# Altium project Robot_Arm.PrjPcb
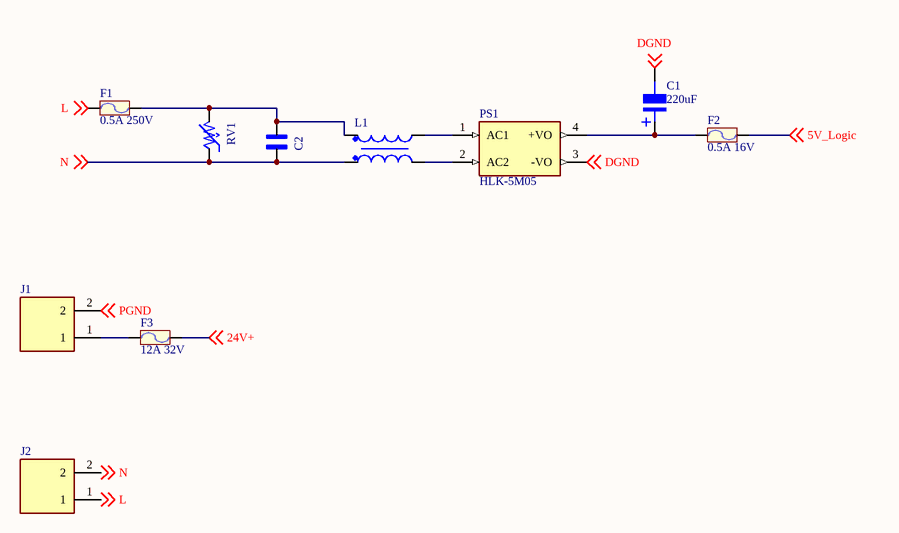
[diagram p0: Sources.SchDoc]
7 sheets, 147 parts. Net scope: global (net labels, ports and power ports of the same name join across sheets).
Sheets:
  Sources.SchDoc
  Driver_1.SchDoc
  Buck_Converter.SchDoc
  ESP32_Board.SchDoc
  Driver_2.SchDoc
  Driver_3.SchDoc
  Driver_4.SchDoc

## Sheet Sources.SchDoc
size A4; SheetNumber: 1; SheetTotal: 7

### Parts
C1  220uF  [tu nhom 8 (e)]
C2  R46KI315050M2K  [CAPRR1500W60L1800T600H1210]  (value not drawn)
F1  0.5A 250V  [Cau Chi SMD1808]
F2  0.5A 16V  [Cau Chi SMD1808]
F3  12A 32V  [Cau Chi SMD1808]
J1  KF301-2P  [HANDSON_KF301-2P]  (value not drawn)
J2  KF301-2P  [HANDSON_KF301-2P]  (value not drawn)
L1  WE-CMB_XS  [WE-CMB_XS]  (value not drawn)
PS1  HLK-5M05  [CONV_HLK-5M05]
RV1  MOV-10D561K  [VAR_MOV-10D561K]  (value not drawn)

### Nets
5V_Logic: F2.2 ; off-sheet 5V_Logic
24V+: F3.2 ; off-sheet 24V+
DGND: C1.2 PS1.3(-VO) ; off-sheet DGND
L: F1.1 J2.1 ; off-sheet L
N: C2.2 J2.2 L1.2 RV1.1 ; off-sheet N
PGND: J1.2 ; off-sheet PGND
NetC1_1: C1.1 F2.1 PS1.4(+VO)
NetC2_1: C2.1 F1.2 L1.1 RV1.2
NetF3_1: F3.1 J1.1
NetL1_3: L1.3 PS1.2(AC2)
NetL1_4: L1.4 PS1.1(AC1)

### Notes on the sheet
- (in symbol Tu Nhom 220uF 10V) +

### Library data of the parts
C1 = Tu Nhom 220uF 10V: Dán; So_Chan: 2; Ten_Linh_Kien: Tụ Nhôm 220uF 10V; Ma_Hang: MH004021; Don_Vi: Con; Chung_Loai: Dán; Kieu_Chan: *
C2 = R46KI315050M2K: 0.15 ÂµF Film Capacitor 275V 560V Polypropylene (PP), Metallized Radial; MF: KEMET; SnapEDA_Link: https://www.snapeda.com/parts/R46KI315050M2K/KEMET/view-part/?ref=snap; Package: RADIAL-2 KEMET; Value: *; MP: R46KI315050M2K; Check_prices: https://www.snapeda.com/parts/R46KI315050M2K/KEMET/view-part/?ref=eda
F1-F3 = Cau chi 0.5A 125V SMD1808: Ma_Hang: MH009241; Ten: Cầu Chì 0.5A 125V SMD1808 0451.500MRL
J1 J2 = KF301-2P: 2 Pin Terminal Block 5mm Pitch; MF: Handson Technology; SnapEDA_Link: https://www.snapeda.com/parts/KF301-2P/Handson+Technology/view-part/?ref=snap; Package: None; Value: *; MP: KF301-2P; Check_prices: https://www.snapeda.com/parts/KF301-2P/Handson+Technology/view-part/?ref=eda
L1 = WE-CMB_XS: Size Typ XS; L = 10 mH; IR = 0.7 A; RDC = 350 mâ„¦; MF: Wurth Electronics; MP: 744821110; SnapEDA_Link: https://www.snapeda.com/parts/744821110/Wurth+Electronics/view-part/?ref=snap; Package: Vertical-4 WÃ¼rth Elektronik; Value: *; Check_prices: https://www.snapeda.com/parts/744821110/Wurth+Electronics/view-part/?ref=eda
PS1 = HLK-5M05: AC DC 220V to 5V 5W 5Watt Isolated Switching Step-Down Power Supply Module Converter; MF: Hi-link; Check_prices: https://www.snapeda.com/parts/HLK-5M05/Hi-link/view-part/?ref=eda; SnapEDA_Link: https://www.snapeda.com/parts/HLK-5M05/Hi-link/view-part/?ref=snap; Price: None; Availability: Not in stock; Package: Package; MP: HLK-5M05; Value: *
RV1 = MOV-10D561K: 560 V 2.5 kA Varistor 1 Circuit Through Hole Disc 10mm; MF: Bourns; SnapEDA_Link: https://www.snapeda.com/parts/MOV-10D561K/Bourns/view-part/?ref=snap; Package: Package; Value: *; MP: MOV-10D561K; Check_prices: https://www.snapeda.com/parts/MOV-10D561K/Bourns/view-part/?ref=eda

## Sheet Driver_1.SchDoc
size A4; SheetNumber: 2; SheetTotal: 7
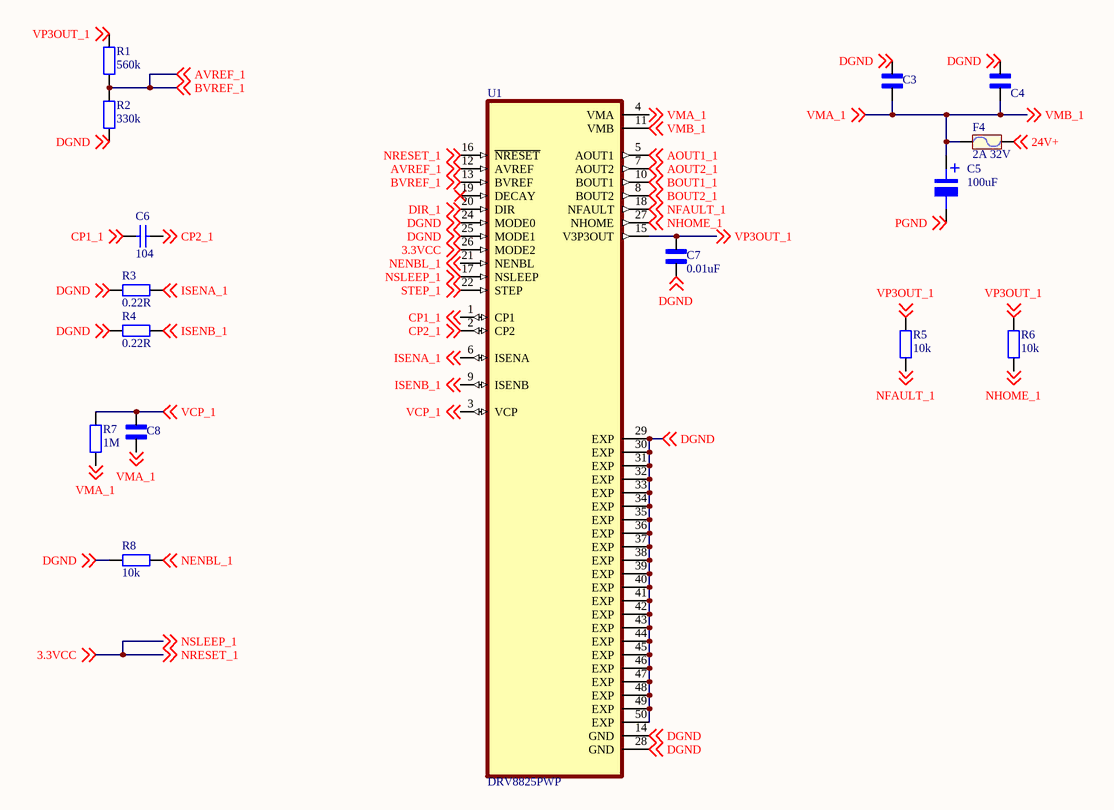
[diagram p1: Driver_1.SchDoc]

### Parts
C3  C0402C104K3RACTU  [CAPC1005X55N]  (value not drawn)
C4  C0402C104K3RACTU  [CAPC1005X55N]  (value not drawn)
C5  100uF  [tu nhom 6.3 (d)]
C6  104  [tu 1206]
C7  0.01uF  [CAPC1608X90N]
C8  C0402C104K3RACTU  [CAPC1005X55N]  (value not drawn)
F4  2A 32V  [Cau chi tu phuc hoi 2A 24V SMD1812]
R1  560k  [Tro SMD 0805]
R2  330k  [Tro SMD 0805]
R3  0.22R  [tro smd 0805]
R4  0.22R  [tro smd 0805]
R5  10k  [tro smd 0805]
R6  10k  [tro smd 0805]
R7  1M  [tro smd 0805]
R8  10k  [tro smd 0805]
U1  DRV8825PWP  [IC_TPS61196PWPRQ1]

### Nets
3.3VCC: U1.16(~{NRESET}) U1.17(NSLEEP) U1.26(MODE2) ; off-sheet 3.3VCC, off-sheet NRESET_1, off-sheet NSLEEP_1  [also labelled NRESET_1, NSLEEP_1]
24V+: F4.2 ; off-sheet 24V+
AOUT1_1: U1.5(AOUT1) ; off-sheet AOUT1_1
AOUT2_1: U1.7(AOUT2) ; off-sheet AOUT2_1
AVREF_1: R1.1 R2.2 U1.12(AVREF) U1.13(BVREF) ; off-sheet AVREF_1, off-sheet BVREF_1  [also labelled BVREF_1]
BOUT1_1: U1.10(BOUT1) ; off-sheet BOUT1_1
BOUT2_1: U1.8(BOUT2) ; off-sheet BOUT2_1
CP1_1: C6.1 U1.1(CP1) ; off-sheet CP1_1
CP2_1: C6.2 U1.2(CP2) ; off-sheet CP2_1
DGND: C3.2 C4.2 C7.1 R2.1 R3.1 R4.1 R8.1 U1.14(GND) U1.24(MODE0) U1.25(MODE1) U1.28(GND) U1.29(EXP) U1.30(EXP) U1.31(EXP) U1.32(EXP) U1.33(EXP) U1.34(EXP) U1.35(EXP) U1.36(EXP) U1.37(EXP) U1.38(EXP) U1.39(EXP) U1.40(EXP) U1.41(EXP) U1.42(EXP) U1.43(EXP) U1.44(EXP) U1.45(EXP) U1.46(EXP) U1.47(EXP) U1.48(EXP) U1.49(EXP) U1.50(EXP) ; off-sheet DGND
DIR_1: U1.20(DIR) ; off-sheet DIR_1
ISENA_1: R3.2 U1.6(ISENA) ; off-sheet ISENA_1
ISENB_1: R4.2 U1.9(ISENB) ; off-sheet ISENB_1
NENBL_1: R8.2 U1.21(NENBL) ; off-sheet NENBL_1
NFAULT_1: R5.1 U1.18(NFAULT) ; off-sheet NFAULT_1
NHOME_1: R6.1 U1.27(NHOME) ; off-sheet NHOME_1
PGND: C5.2 ; off-sheet PGND
STEP_1: U1.22(STEP) ; off-sheet STEP_1
VCP_1: C8.2 R7.2 U1.3(VCP) ; off-sheet VCP_1
VMA_1: C3.1 C4.1 C5.1 C8.1 F4.1 R7.1 U1.4(VMA) U1.11(VMB) ; off-sheet VMA_1, off-sheet VMB_1  [also labelled VMB_1]
VP3OUT_1: C7.2 R1.2 R5.2 R6.2 U1.15(V3P3OUT) ; off-sheet VP3OUT_1

Not connected (* = marked no-connect by the designer): U1 19(DECAY)*

### Notes on the sheet
- (in symbol Tu Nhom 100uF 16V) +

### Library data of the parts
C3 C4 C8 = C0402C104K3RACTU: MF: {'manufacturer': u'KEMET'}; Package: None; Price: None; Value: *; MP: C0402C104K3RACTU; Availability: Unavailable
C5 = Tu Nhom 100uF 16V: Dán; Don_Vi: Con; So_Chan: 2; Ten_Linh_Kien: Tụ Nhôm 100uF 16V 6.3x5.4MM; Ma_Hang: MH002219; Chung_Loai: Dán; Kieu_Chan: *
C6 = Tu 1206 104 50V 20%: Dán; Don_Vi: Con; So_Chan: 2; Ten_Linh_Kien: Tụ 1206 104-0.1uF 20% 50V; Ma_Hang: MH004544; Chung_Loai: Dán; Kieu_Chan: *
C7 = GCE188R72A103KA01D: 0603 0.01 uF 100 V Â±10% Tolerance X7R Multilayer Ceramic Capacitor; MF: Murata; Package: 1608 Murata; Check_prices: https://www.snapeda.com/parts/GCE188R72A103KA01D/Murata%20Electronics%20North%20America/view-part/1764845/?ref=eda; Value: *; Price: None; Purchase-URL: https://pricing.snapeda.com/search/part/GCE188R72A103KA01D/?ref=eda; MP: GCE188R72A103KA01D; Availability: Good; SnapEDA_Link: https://www.snapeda.com/parts/GCE188R72A103KA01D/Murata%20Electronics%20North%20America/view-part/1764845/?ref=snap
F4 = Cau chi tu phuc hoi 2A 24V SMD1812: 2A 24V SMD1812; Ma_Hang: MH010033; Ten: Cầu Chì Tự Phục Hồi 2A 24V SMD1812
R1 = Tro 0805 5% 560k: Dán; Don_Vi: Con; Ma_Hang: MH005342; Ten_Linh_Kien: Trở 0805 5% 560k; So_Chan: 2; Chung_Loai: Dán; Kieu_Chan: *
R2 = Tro 0805 5% 330k: Dán; Don_Vi: Con; So_Chan: 2; Ten_Linh_Kien: Trở 0805 5% 330K; Ma_Hang: MH005336; Chung_Loai: Dán; Kieu_Chan: *
R3 R4 = Tro 0805 1% 0.22R: Dán; Don_Vi: Con; So_Chan: 2; Ten_Linh_Kien: Trở 0805 1% 0.22R; Ma_Hang: MH005466; Chung_Loai: Dán; Kieu_Chan: *
R5 R6 R8 = Tro 0805 1% 10k: Dán; Don_Vi: Con; So_Chan: 2; Ten_Linh_Kien: Trở 0805 1% 10k; Ma_Hang: MH005473; Chung_Loai: Dán; Kieu_Chan: *
R7 = Tro 0805 1% 1M: Dán; Don_Vi: Con; So_Chan: 2; Ten_Linh_Kien: Trở 0805 1% 1M; Ma_Hang: MH005469; Chung_Loai: Dán; Kieu_Chan: *
U1 = DRV8825PWP: <a href="https://snapeda.com/parts/DRV8825PWP/Texas%20Instruments/view-part/?ref=eda">Buy Part</a>; Package: None; Availability: Unavailable; Value: *; MP: DRV8825PWP; Price: None

## Sheet Buck_Converter.SchDoc
size A4; SheetNumber: 3; SheetTotal: 7
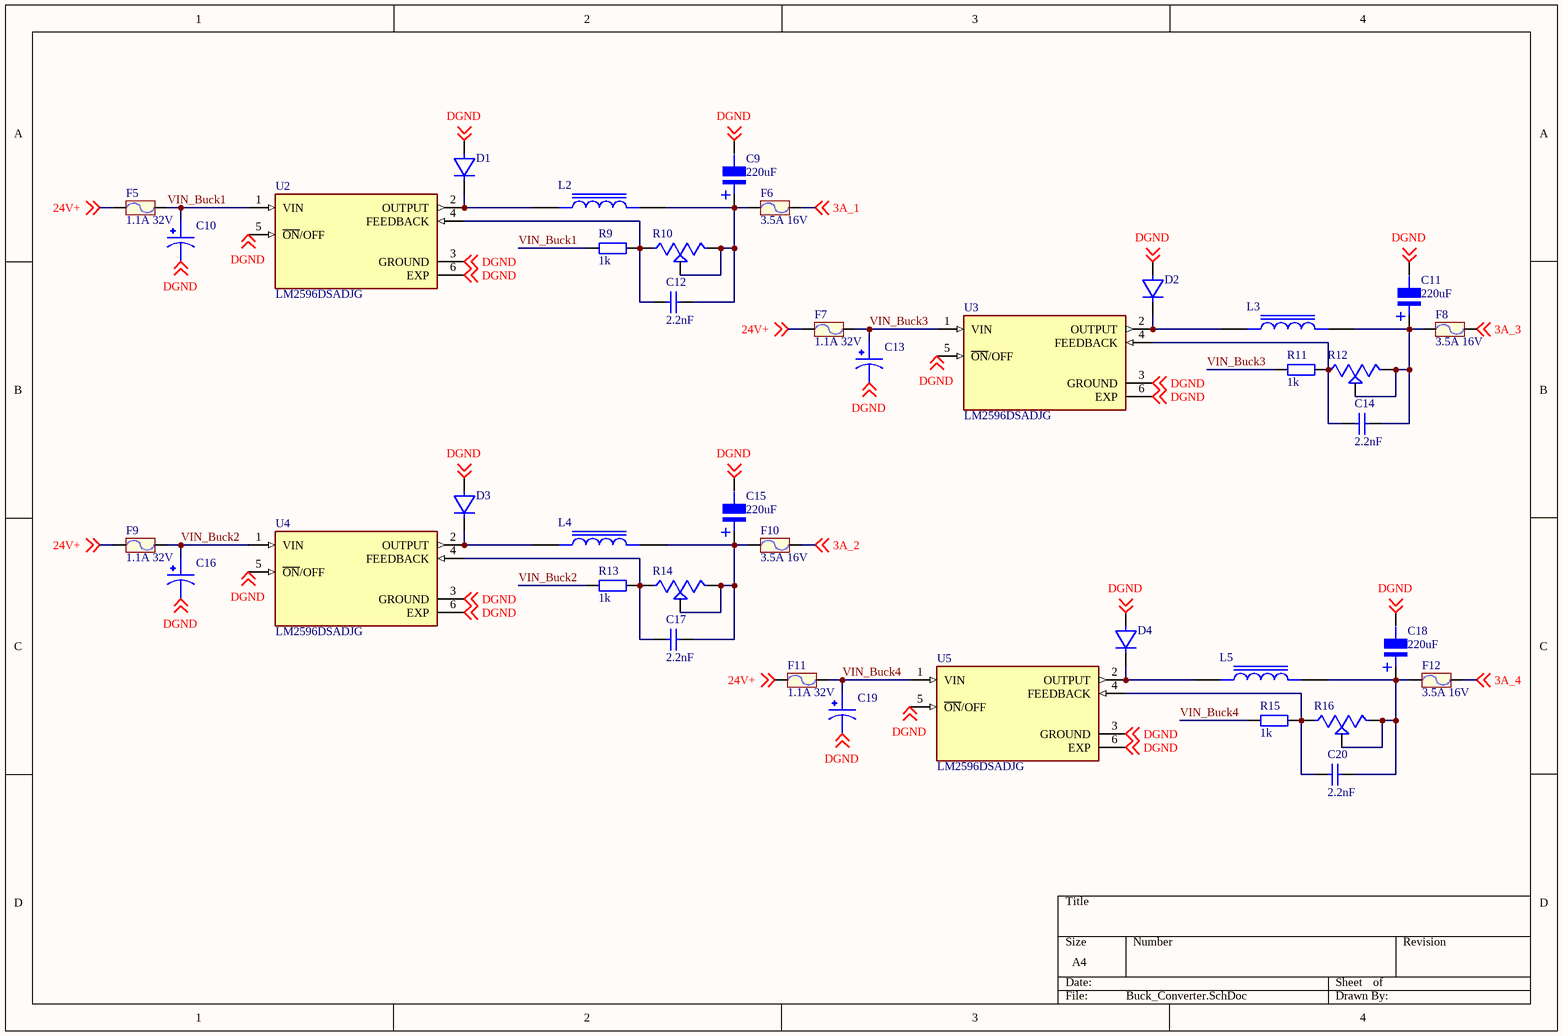
[diagram p2: Buck_Converter.SchDoc]

### Parts
C9  220uF  [tu nhom 8 (f)]
C10  UPW1V471MPD  [CAPPRD500W60D1050H2200]  (value not drawn)
C11  220uF  [tu nhom 8 (f)]
C12  2.2nF  [tu 0805]
C13  UPW1V471MPD  [CAPPRD500W60D1050H2200]  (value not drawn)
C14  2.2nF  [tu 0805]
C15  220uF  [tu nhom 8 (f)]
C16  UPW1V471MPD  [CAPPRD500W60D1050H2200]  (value not drawn)
C17  2.2nF  [tu 0805]
C18  220uF  [tu nhom 8 (f)]
C19  UPW1V471MPD  [CAPPRD500W60D1050H2200]  (value not drawn)
C20  2.2nF  [tu 0805]
D1  SR540  [DO-241]  (value not drawn)
D2  SR540  [DO-241]  (value not drawn)
D3  SR540  [DO-241]  (value not drawn)
D4  SR540  [DO-241]  (value not drawn)
F5  1.1A 32V  [Cau chi tu phuc hoi 2A 24V SMD1812]
F6  3.5A 16V  [Cau chi tu phuc hoi 2A 24V SMD1812]
F7  1.1A 32V  [Cau chi tu phuc hoi 2A 24V SMD1812]
F8  3.5A 16V  [Cau chi tu phuc hoi 2A 24V SMD1812]
F9  1.1A 32V  [Cau chi tu phuc hoi 2A 24V SMD1812]
F10  3.5A 16V  [Cau chi tu phuc hoi 2A 24V SMD1812]
F11  1.1A 32V  [Cau chi tu phuc hoi 2A 24V SMD1812]
F12  3.5A 16V  [Cau chi tu phuc hoi 2A 24V SMD1812]
L2  F1F3-1004T-470M  [IND_F1F3-1004T-470M]  (value not drawn)
L3  F1F3-1004T-470M  [IND_F1F3-1004T-470M]  (value not drawn)
L4  F1F3-1004T-470M  [IND_F1F3-1004T-470M]  (value not drawn)
L5  F1F3-1004T-470M  [IND_F1F3-1004T-470M]  (value not drawn)
R9  1k  [tro smd 0805]
R10  35WR10KLFTR  [TRIM_35WR10KLFTR]  (value not drawn)
R11  1k  [tro smd 0805]
R12  35WR10KLFTR  [TRIM_35WR10KLFTR]  (value not drawn)
R13  1k  [tro smd 0805]
R14  35WR10KLFTR  [TRIM_35WR10KLFTR]  (value not drawn)
R15  1k  [tro smd 0805]
R16  35WR10KLFTR  [TRIM_35WR10KLFTR]  (value not drawn)
U2  LM2596DSADJG  [CONV_LM2596DSADJG]
U3  LM2596DSADJG  [CONV_LM2596DSADJG]
U4  LM2596DSADJG  [CONV_LM2596DSADJG]
U5  LM2596DSADJG  [CONV_LM2596DSADJG]

### Nets
3A_1: F6.2 ; off-sheet 3A_1
3A_2: F10.2 ; off-sheet 3A_2
3A_3: F8.2 ; off-sheet 3A_3
3A_4: F12.2 ; off-sheet 3A_4
24V+: F5.1 F7.1 F9.1 F11.1 ; off-sheet 24V+
DGND: C9.2 C10.2 C11.2 C13.2 C15.2 C16.2 C18.2 C19.2 D1.2(A) D2.2(A) D3.2(A) D4.2(A) U2.3(GROUND) U2.5(~{ON}/OFF) U2.6(EXP) U3.3(GROUND) U3.5(~{ON}/OFF) U3.6(EXP) U4.3(GROUND) U4.5(~{ON}/OFF) U4.6(EXP) U5.3(GROUND) U5.5(~{ON}/OFF) U5.6(EXP) ; off-sheet DGND
VIN_Buck1: C10.1 F5.2 R9.1 U2.1(VIN)
VIN_Buck2: C16.1 F9.2 R13.1 U4.1(VIN)
VIN_Buck3: C13.1 F7.2 R11.1 U3.1(VIN)
VIN_Buck4: C19.1 F11.2 R15.1 U5.1(VIN)
NetC9_1: C9.1 C12.2 F6.1 L2.2 R10.2 R10.3
NetC11_1: C11.1 C14.2 F8.1 L3.2 R12.2 R12.3
NetC12_1: C12.1 R9.2 R10.1 U2.4(FEEDBACK)
NetC14_1: C14.1 R11.2 U3.4(FEEDBACK)
NetC15_1: C15.1 C17.2 F10.1 L4.2 R14.2 R14.3
NetC17_1: C17.1 R13.2 R14.1 U4.4(FEEDBACK)
NetC18_1: C18.1 C20.2 F12.1 L5.2 R16.2 R16.3
NetC20_1: C20.1 R15.2 R16.1 U5.4(FEEDBACK)
NetD1_1: D1.1(K) L2.1 U2.2(OUTPUT)
NetD2_1: D2.1(K) L3.1 U3.2(OUTPUT)
NetD3_1: D3.1(K) L4.1 U4.2(OUTPUT)
NetD4_1: D4.1(K) L5.1 U5.2(OUTPUT)

Not connected (* = marked no-connect by the designer): R12 1

### Notes on the sheet
- (in symbol Tu Nhom 220uF 25V) +

### Library data of the parts
C9 C11 C15 C18 = Tu Nhom 220uF 25V: Dán; Don_Vi: Con; So_Chan: 2; Ten_Linh_Kien: Tụ Nhôm 220uF 25V; Ma_Hang: MH002221; Chung_Loai: Dán; Kieu_Chan: *
C10 C13 C16 C19 = UPW1V471MPD: Capacitor Aluminum Electrolytic, 5000h 10 (Dia.) x 20mm, 470uf 35VDC, PW Series | Nichicon UPW1V471MPD; SnapEDA_Link: https://www.snapeda.com/parts/UPW1V471MPD/Nichicon/view-part/?ref=snap; Package: None; Value: *; MF: Nichicon; MP: UPW1V471MPD; Check_prices: https://www.snapeda.com/parts/UPW1V471MPD/Nichicon/view-part/?ref=eda
C12 C14 C17 C20 = Tu 0805 222 50V 10%: Dán; Don_Vi: Con; So_Chan: 2; Ten_Linh_Kien: Tụ 0805 222-2.2nF 10% 50V; Ma_Hang: MH004557; Chung_Loai: Dán; Kieu_Chan: *
D1-D4 = SR540: Diode Schottky 40V 5A 2-Pin DO-201AD; MF: Rectron; Package: None; Availability: In Stock; Check_prices: https://www.snapeda.com/parts/SR540/Rectron/view-part/?ref=eda; Value: *; MP: SR540; Purchase-URL: https://pricing.snapeda.com/search/part/SR540/?ref=eda; SnapEDA_Link: https://www.snapeda.com/parts/SR540/Rectron/view-part/?ref=snap; Price: None
F5-F12 = Cau chi tu phuc hoi 2A 24V SMD1812: as F4 on sheet Driver_1
R9 R11 R13 R15 = Tro 0805 1% 1k: Dán; Don_Vi: Con; So_Chan: 2; Ten_Linh_Kien: Trở 0805 1% 1k; Ma_Hang: MH005468; Chung_Loai: Dán; Kieu_Chan: *
R10 R12 R14 R16 = 35WR10KLFTR: 10 kOhms 0.1W, 1/10W Surface Mount Surface Mount Trimmer Potentiometer Cermet 1.0 Turn Top Adjustment; MF: TT; SnapEDA_Link: https://www.snapeda.com/parts/35WR10KLFTR/TT+Electronics%252FBI/view-part/?ref=snap; Package: FakePackage u; Value: *; MP: 35WR10KLFTR; Check_prices: https://www.snapeda.com/parts/35WR10KLFTR/TT+Electronics%252FBI/view-part/?ref=eda
U2-U5 = LM2596DSADJG: LM2596DSADJG Switching Regulator 3A Adjustable, 1.23 to 37 V, 5-Pin D2PAK | ON Semiconductor LM2596DSADJG; SnapEDA_Link: https://www.snapeda.com/parts/LM2596DSADJG/Onsemi/view-part/?ref=snap; Package: D2PAK-5 ON Semiconductor; Value: *; MF: ON Semiconductor; MP: LM2596DSADJG; Check_prices: https://www.snapeda.com/parts/LM2596DSADJG/Onsemi/view-part/?ref=eda
L2-L5 = F1F3-1004T-470M: Package: None; Price: None; Value: *; MP: F1F3-1004T-470M; Availability: Unavailable

## Sheet ESP32_Board.SchDoc
size A4; SheetNumber: 4; SheetTotal: 7
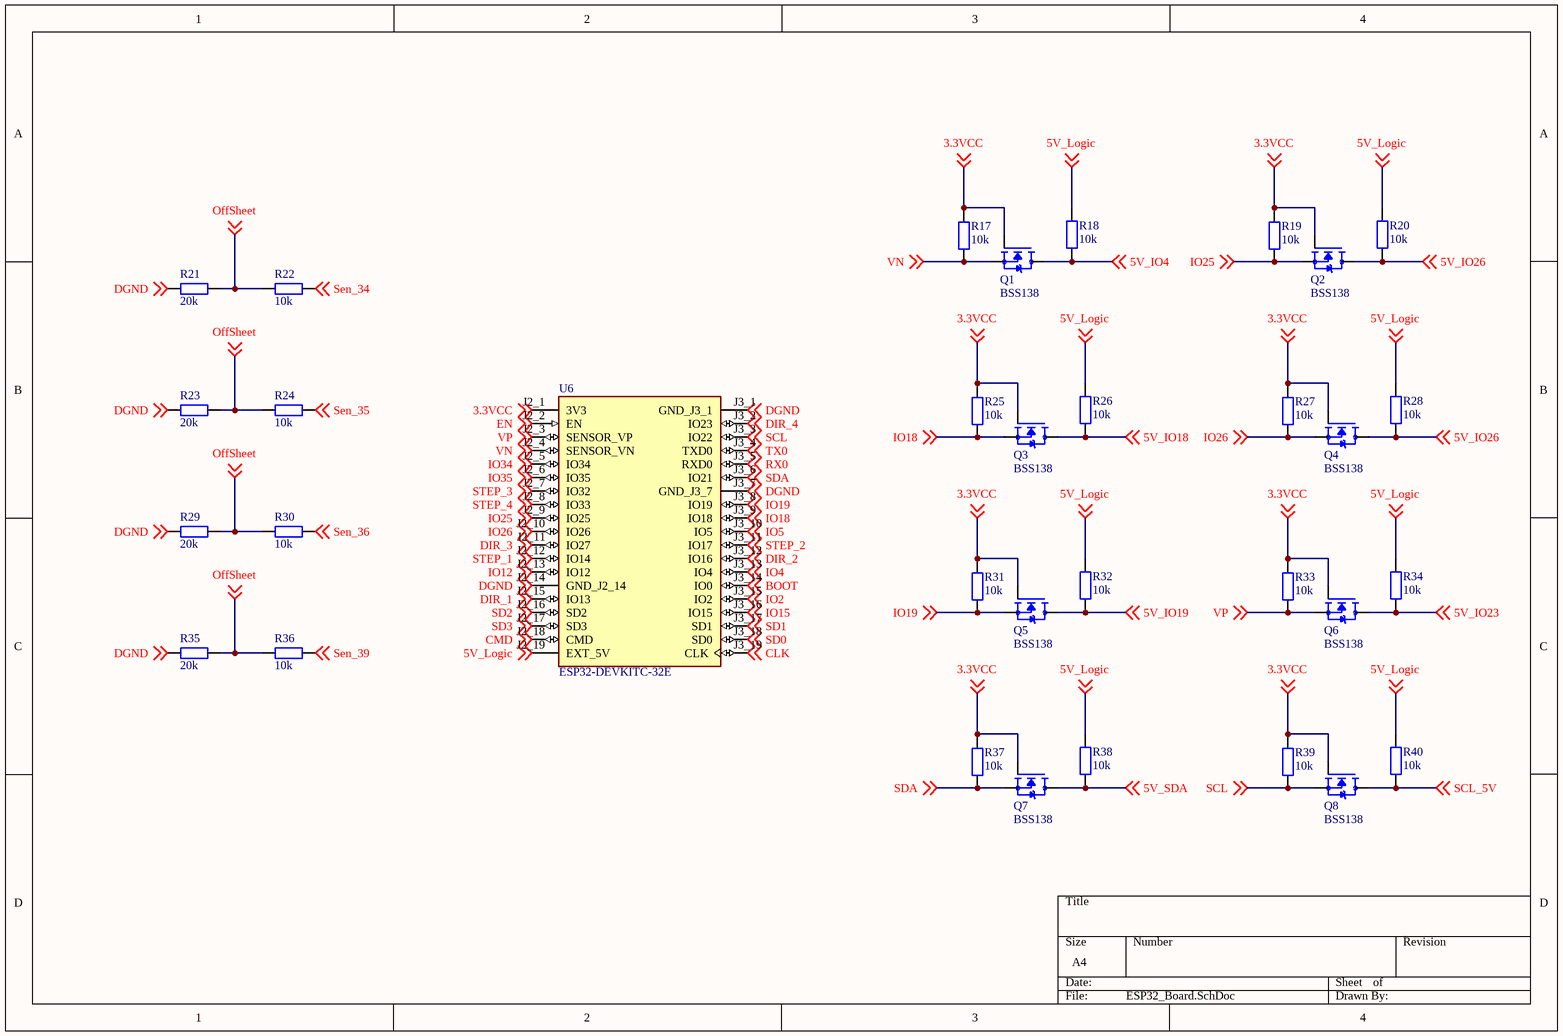
[diagram p3: ESP32_Board.SchDoc]

### Parts
Q1  BSS138  [SOT95P240X111-3N]
Q2  BSS138  [SOT95P240X111-3N]
Q3  BSS138  [SOT95P240X111-3N]
Q4  BSS138  [SOT95P240X111-3N]
Q5  BSS138  [SOT95P240X111-3N]
Q6  BSS138  [SOT95P240X111-3N]
Q7  BSS138  [SOT95P240X111-3N]
Q8  BSS138  [SOT95P240X111-3N]
R17  10k  [tro smd 0805]
R18  10k  [tro smd 0805]
R19  10k  [tro smd 0805]
R20  10k  [tro smd 0805]
R21  20k  [tro smd 0805]
R22  10k  [tro smd 0805]
R23  20k  [tro smd 0805]
R24  10k  [tro smd 0805]
R25  10k  [tro smd 0805]
R26  10k  [tro smd 0805]
R27  10k  [tro smd 0805]
R28  10k  [tro smd 0805]
R29  20k  [tro smd 0805]
R30  10k  [tro smd 0805]
R31  10k  [tro smd 0805]
R32  10k  [tro smd 0805]
R33  10k  [tro smd 0805]
R34  10k  [tro smd 0805]
R35  20k  [tro smd 0805]
R36  10k  [tro smd 0805]
R37  10k  [tro smd 0805]
R38  10k  [tro smd 0805]
R39  10k  [tro smd 0805]
R40  10k  [tro smd 0805]
U6  ESP32-DEVKITC-32E  [MODULE_ESP32-DEVKITC-32E]

### Nets
3.3VCC: Q1.1(G) Q2.1(G) Q3.1(G) Q4.1(G) Q5.1(G) Q6.1(G) Q7.1(G) Q8.1(G) R17.1 R19.1 R25.1 R27.1 R31.1 R33.1 R37.1 R39.1 U6.J2_1(3V3) ; off-sheet 3.3VCC
5V_IO4: Q1.3(D) R18.2 ; off-sheet 5V_IO4
5V_IO18: Q3.3(D) R26.2 ; off-sheet 5V_IO18
5V_IO19: Q5.3(D) R32.2 ; off-sheet 5V_IO19
5V_IO23: Q6.3(D) R34.2 ; off-sheet 5V_IO23
5V_IO26: Q2.3(D) Q4.3(D) R20.2 R28.2 ; off-sheet 5V_IO26
5V_Logic: R18.1 R20.1 R26.1 R28.1 R32.1 R34.1 R38.1 R40.1 U6.J2_19(EXT_5V) ; off-sheet 5V_Logic
5V_SDA: Q7.3(D) R38.2 ; off-sheet 5V_SDA
BOOT: U6.J3_14(IO0) ; off-sheet BOOT
CLK: U6.J3_19(CLK) ; off-sheet CLK
CMD: U6.J2_18(CMD) ; off-sheet CMD
DGND: R21.1 R23.1 R29.1 R35.1 U6.J2_14(GND_J2_14) U6.J3_1(GND_J3_1) U6.J3_7(GND_J3_7) ; off-sheet DGND
DIR_1: U6.J2_15(IO13) ; off-sheet DIR_1
DIR_2: U6.J3_12(IO16) ; off-sheet DIR_2
DIR_3: U6.J2_11(IO27) ; off-sheet DIR_3
DIR_4: U6.J3_2(IO23) ; off-sheet DIR_4
EN: U6.J2_2(EN) ; off-sheet EN
IO2: U6.J3_15(IO2) ; off-sheet IO2
IO4: U6.J3_13(IO4) ; off-sheet IO4
IO5: U6.J3_10(IO5) ; off-sheet IO5
IO12: U6.J2_13(IO12) ; off-sheet IO12
IO15: U6.J3_16(IO15) ; off-sheet IO15
IO18: Q3.2(S) R25.2 U6.J3_9(IO18) ; off-sheet IO18
IO19: Q5.2(S) R31.2 U6.J3_8(IO19) ; off-sheet IO19
IO25: Q2.2(S) R19.2 U6.J2_9(IO25) ; off-sheet IO25
IO26: Q4.2(S) R27.2 U6.J2_10(IO26) ; off-sheet IO26
IO34: U6.J2_5(IO34) ; off-sheet IO34
IO35: U6.J2_6(IO35) ; off-sheet IO35
OffSheet: R21.2 R22.1 R23.2 R24.1 R29.2 R30.1 R35.2 R36.1 ; off-sheet OffSheet
RX0: U6.J3_5(RXD0) ; off-sheet RX0
SCL: Q8.2(S) R39.2 U6.J3_3(IO22) ; off-sheet SCL
SCL_5V: Q8.3(D) R40.2 ; off-sheet SCL_5V
SD0: U6.J3_18(SD0) ; off-sheet SD0
SD1: U6.J3_17(SD1) ; off-sheet SD1
SD2: U6.J2_16(SD2) ; off-sheet SD2
SD3: U6.J2_17(SD3) ; off-sheet SD3
SDA: Q7.2(S) R37.2 U6.J3_6(IO21) ; off-sheet SDA
Sen_34: R22.2 ; off-sheet Sen_34
Sen_35: R24.2 ; off-sheet Sen_35
Sen_36: R30.2 ; off-sheet Sen_36
Sen_39: R36.2 ; off-sheet Sen_39
STEP_1: U6.J2_12(IO14) ; off-sheet STEP_1
STEP_2: U6.J3_11(IO17) ; off-sheet STEP_2
STEP_3: U6.J2_7(IO32) ; off-sheet STEP_3
STEP_4: U6.J2_8(IO33) ; off-sheet STEP_4
TX0: U6.J3_4(TXD0) ; off-sheet TX0
VN: Q1.2(S) R17.2 U6.J2_4(SENSOR_VN) ; off-sheet VN
VP: Q6.2(S) R33.2 U6.J2_3(SENSOR_VP) ; off-sheet VP

### Library data of the parts
Q1-Q8 = BSS138: N-Channel 50 V 220mA (Ta) 350mW (Ta) Surface Mount SOT-23-3; MF: onsemi; SnapEDA_Link: https://www.snapeda.com/parts/BSS138/Onsemi/view-part/?ref=snap; Package: SOT-23-3 ON Semiconductor; Value: *; MP: BSS138; Check_prices: https://www.snapeda.com/parts/BSS138/Onsemi/view-part/?ref=eda
R17-R20 R22 R24-R28 R30-R34 R36-R40 = Tro 0805 1% 10k: as R5 on sheet Driver_1; Chung_Loai: Dán; Kieu_Chan: *
R21 R23 R29 R35 = Tro 0805 5% 20k: Dán; Don_Vi: Con; So_Chan: 2; Ten_Linh_Kien: Trở 0805 5% 20k; Ma_Hang: MH005247; Chung_Loai: Dán; Kieu_Chan: *
U6 = ESP32-DEVKITC-32E: The ESP32-DEVKITC-32E transceiver evaluation board from Espressif Systems is a powerful development tool for wireless communication technologies. It supports 802.11 b/g/n Wi-Fi and BluetoothÂ® Smart Ready 4.x (BLE) dual-mode at 2.4GHz, making it ideal for; SnapEDA_Link: https://www.snapeda.com/parts/ESP32-DEVKITC-32E/Espressif+Systems/view-part/?ref=snap; Package: None; Value: *; MF: Espressif Systems; MP: ESP32-DEVKITC-32E; Check_prices: https://www.snapeda.com/parts/ESP32-DEVKITC-32E/Espressif+Systems/view-part/?ref=eda

## Sheet Driver_2.SchDoc
size A; SheetNumber: 5; SheetTotal: 7
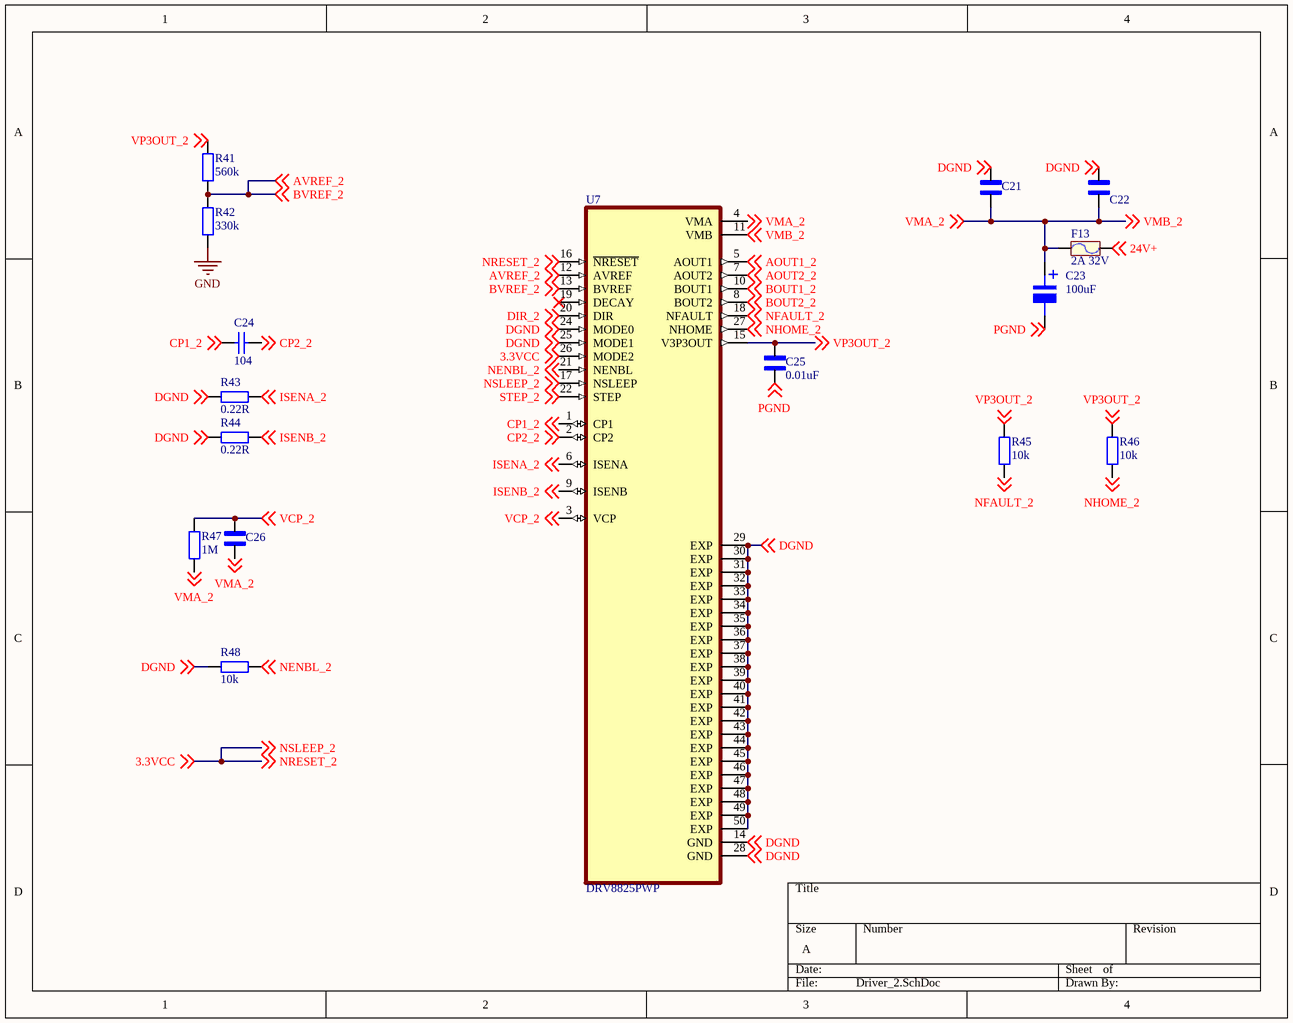
[diagram p4: Driver_2.SchDoc]

### Parts
C21  C0402C104K3RACTU  [CAPC1005X55N]  (value not drawn)
C22  C0402C104K3RACTU  [CAPC1005X55N]  (value not drawn)
C23  100uF  [tu nhom 6.3 (d)]
C24  104  [tu 1206]
C25  0.01uF  [CAPC1608X90N]
C26  C0402C104K3RACTU  [CAPC1005X55N]  (value not drawn)
F13  2A 32V  [Cau chi tu phuc hoi 2A 24V SMD1812]
R41  560k  [Tro SMD 0805]
R42  330k  [Tro SMD 0805]
R43  0.22R  [tro smd 0805]
R44  0.22R  [tro smd 0805]
R45  10k  [tro smd 0805]
R46  10k  [tro smd 0805]
R47  1M  [tro smd 0805]
R48  10k  [tro smd 0805]
U7  DRV8825PWP  [IC_TPS61196PWPRQ1]

### Nets
GND: R42.1
3.3VCC: U7.16(~{NRESET}) U7.17(NSLEEP) U7.26(MODE2) ; off-sheet 3.3VCC, off-sheet NRESET_2, off-sheet NSLEEP_2  [also labelled NRESET_2, NSLEEP_2]
24V+: F13.2 ; off-sheet 24V+
AOUT1_2: U7.5(AOUT1) ; off-sheet AOUT1_2
AOUT2_2: U7.7(AOUT2) ; off-sheet AOUT2_2
AVREF_2: R41.1 R42.2 U7.12(AVREF) U7.13(BVREF) ; off-sheet AVREF_2, off-sheet BVREF_2  [also labelled BVREF_2]
BOUT1_2: U7.10(BOUT1) ; off-sheet BOUT1_2
BOUT2_2: U7.8(BOUT2) ; off-sheet BOUT2_2
CP1_2: C24.1 U7.1(CP1) ; off-sheet CP1_2
CP2_2: C24.2 U7.2(CP2) ; off-sheet CP2_2
DGND: C21.2 C22.2 R43.1 R44.1 R48.1 U7.14(GND) U7.24(MODE0) U7.25(MODE1) U7.28(GND) U7.29(EXP) U7.30(EXP) U7.31(EXP) U7.32(EXP) U7.33(EXP) U7.34(EXP) U7.35(EXP) U7.36(EXP) U7.37(EXP) U7.38(EXP) U7.39(EXP) U7.40(EXP) U7.41(EXP) U7.42(EXP) U7.43(EXP) U7.44(EXP) U7.45(EXP) U7.46(EXP) U7.47(EXP) U7.48(EXP) U7.49(EXP) U7.50(EXP) ; off-sheet DGND
DIR_2: U7.20(DIR) ; off-sheet DIR_2
ISENA_2: R43.2 U7.6(ISENA) ; off-sheet ISENA_2
ISENB_2: R44.2 U7.9(ISENB) ; off-sheet ISENB_2
NENBL_2: R48.2 U7.21(NENBL) ; off-sheet NENBL_2
NFAULT_2: R45.1 U7.18(NFAULT) ; off-sheet NFAULT_2
NHOME_2: R46.1 U7.27(NHOME) ; off-sheet NHOME_2
PGND: C23.2 C25.1 ; off-sheet PGND
STEP_2: U7.22(STEP) ; off-sheet STEP_2
VCP_2: C26.2 R47.2 U7.3(VCP) ; off-sheet VCP_2
VMA_2: C21.1 C22.1 C23.1 C26.1 F13.1 R47.1 U7.4(VMA) U7.11(VMB) ; off-sheet VMA_2, off-sheet VMB_2  [also labelled VMB_2]
VP3OUT_2: C25.2 R41.2 R45.2 R46.2 U7.15(V3P3OUT) ; off-sheet VP3OUT_2

Not connected (* = marked no-connect by the designer): U7 19(DECAY)*

### Notes on the sheet
- (in symbol Tu Nhom 100uF 16V) +

### Library data of the parts
C21 C22 C26 = C0402C104K3RACTU: MF: {'manufacturer': u'KEMET'}; Package: None; Price: None; Value: *; MP: C0402C104K3RACTU; Availability: Unavailable
C23 = Tu Nhom 100uF 16V: as C5 on sheet Driver_1; Chung_Loai: Dán; Kieu_Chan: *
C24 = Tu 1206 104 50V 20%: as C6 on sheet Driver_1; Chung_Loai: Dán; Kieu_Chan: *
C25 = GCE188R72A103KA01D: as C7 on sheet Driver_1; Package: 1608 Murata; Check_prices: https://www.snapeda.com/parts/GCE188R72A103KA01D/Murata%20Electronics%20North%20America/view-part/1764845/?ref=eda; Value: *; Price: None; Purchase-URL: https://pricing.snapeda.com/search/part/GCE188R72A103KA01D/?ref=eda; MP: GCE188R72A103KA01D; Availability: Good; SnapEDA_Link: https://www.snapeda.com/parts/GCE188R72A103KA01D/Murata%20Electronics%20North%20America/view-part/1764845/?ref=snap
F13 = Cau chi tu phuc hoi 2A 24V SMD1812: as F4 on sheet Driver_1
R41 = Tro 0805 5% 560k: as R1 on sheet Driver_1; Chung_Loai: Dán; Kieu_Chan: *
R42 = Tro 0805 5% 330k: as R2 on sheet Driver_1; Chung_Loai: Dán; Kieu_Chan: *
R43 R44 = Tro 0805 1% 0.22R: as R3 on sheet Driver_1; Chung_Loai: Dán; Kieu_Chan: *
R45 R46 R48 = Tro 0805 1% 10k: as R5 on sheet Driver_1; Chung_Loai: Dán; Kieu_Chan: *
R47 = Tro 0805 1% 1M: as R7 on sheet Driver_1; Chung_Loai: Dán; Kieu_Chan: *
U7 = DRV8825PWP: as U1 on sheet Driver_1; Package: None; Availability: Unavailable; Value: *; MP: DRV8825PWP; Price: None

## Sheet Driver_3.SchDoc
size A; SheetNumber: 6; SheetTotal: 7
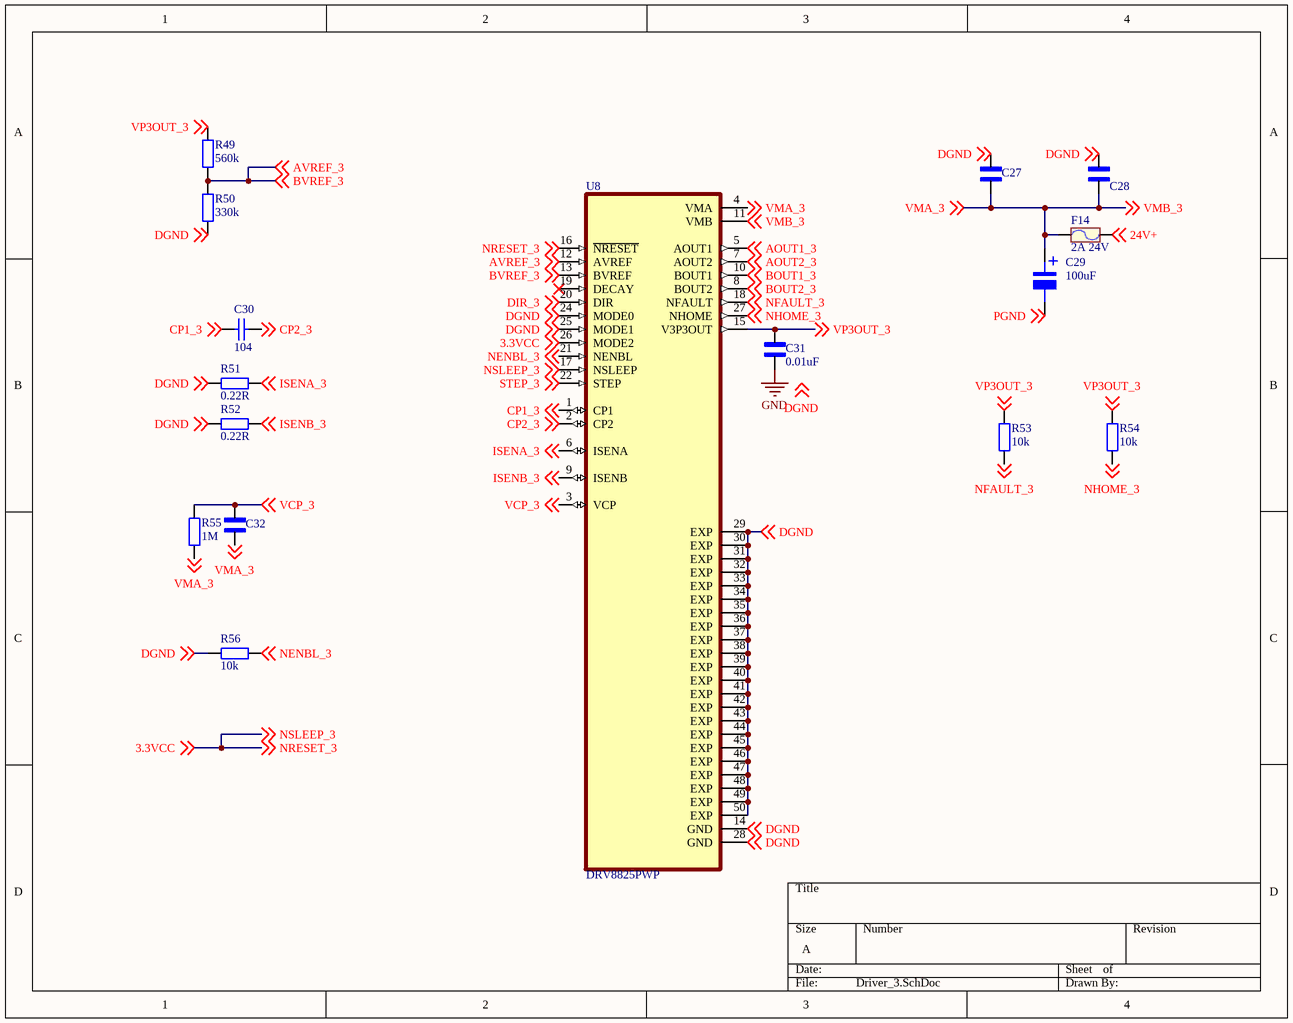
[diagram p5: Driver_3.SchDoc]

### Parts
C27  C0402C104K3RACTU  [CAPC1005X55N]  (value not drawn)
C28  C0402C104K3RACTU  [CAPC1005X55N]  (value not drawn)
C29  100uF  [tu nhom 6.3 (d)]
C30  104  [tu 1206]
C31  0.01uF  [CAPC1608X90N]
C32  C0402C104K3RACTU  [CAPC1005X55N]  (value not drawn)
F14  2A 24V  [Cau chi tu phuc hoi 2A 24V SMD1812]
R49  560k  [Tro SMD 0805]
R50  330k  [Tro SMD 0805]
R51  0.22R  [tro smd 0805]
R52  0.22R  [tro smd 0805]
R53  10k  [tro smd 0805]
R54  10k  [tro smd 0805]
R55  1M  [tro smd 0805]
R56  10k  [tro smd 0805]
U8  DRV8825PWP  [IC_TPS61196PWPRQ1]

### Nets
GND: C31.1
3.3VCC: U8.16(~{NRESET}) U8.17(NSLEEP) U8.26(MODE2) ; off-sheet 3.3VCC, off-sheet NRESET_3, off-sheet NSLEEP_3  [also labelled NRESET_3, NSLEEP_3]
24V+: F14.2 ; off-sheet 24V+
AOUT1_3: U8.5(AOUT1) ; off-sheet AOUT1_3
AOUT2_3: U8.7(AOUT2) ; off-sheet AOUT2_3
AVREF_3: R49.1 R50.2 U8.12(AVREF) U8.13(BVREF) ; off-sheet AVREF_3, off-sheet BVREF_3  [also labelled BVREF_3]
BOUT1_3: U8.10(BOUT1) ; off-sheet BOUT1_3
BOUT2_3: U8.8(BOUT2) ; off-sheet BOUT2_3
CP1_3: C30.1 U8.1(CP1) ; off-sheet CP1_3
CP2_3: C30.2 U8.2(CP2) ; off-sheet CP2_3
DGND: C27.2 C28.2 R50.1 R51.1 R52.1 R56.1 U8.14(GND) U8.24(MODE0) U8.25(MODE1) U8.28(GND) U8.29(EXP) U8.30(EXP) U8.31(EXP) U8.32(EXP) U8.33(EXP) U8.34(EXP) U8.35(EXP) U8.36(EXP) U8.37(EXP) U8.38(EXP) U8.39(EXP) U8.40(EXP) U8.41(EXP) U8.42(EXP) U8.43(EXP) U8.44(EXP) U8.45(EXP) U8.46(EXP) U8.47(EXP) U8.48(EXP) U8.49(EXP) U8.50(EXP) ; off-sheet DGND
DIR_3: U8.20(DIR) ; off-sheet DIR_3
ISENA_3: R51.2 U8.6(ISENA) ; off-sheet ISENA_3
ISENB_3: R52.2 U8.9(ISENB) ; off-sheet ISENB_3
NENBL_3: R56.2 U8.21(NENBL) ; off-sheet NENBL_3
NFAULT_3: R53.1 U8.18(NFAULT) ; off-sheet NFAULT_3
NHOME_3: R54.1 U8.27(NHOME) ; off-sheet NHOME_3
PGND: C29.2 ; off-sheet PGND
STEP_3: U8.22(STEP) ; off-sheet STEP_3
VCP_3: C32.2 R55.2 U8.3(VCP) ; off-sheet VCP_3
VMA_3: C27.1 C28.1 C29.1 C32.1 F14.1 R55.1 U8.4(VMA) U8.11(VMB) ; off-sheet VMA_3, off-sheet VMB_3  [also labelled VMB_3]
VP3OUT_3: C31.2 R49.2 R53.2 R54.2 U8.15(V3P3OUT) ; off-sheet VP3OUT_3

Not connected (* = marked no-connect by the designer): U8 19(DECAY)*

### Notes on the sheet
- Labels drawn without touching a wire or pin: DGND
- (in symbol Tu Nhom 100uF 16V) +

### Library data of the parts
C27 C28 C32 = C0402C104K3RACTU: MF: {'manufacturer': u'KEMET'}; Package: None; Price: None; Value: *; MP: C0402C104K3RACTU; Availability: Unavailable
C29 = Tu Nhom 100uF 16V: as C5 on sheet Driver_1; Chung_Loai: Dán; Kieu_Chan: *
C30 = Tu 1206 104 50V 20%: as C6 on sheet Driver_1; Chung_Loai: Dán; Kieu_Chan: *
C31 = GCE188R72A103KA01D: as C7 on sheet Driver_1; Package: 1608 Murata; Check_prices: https://www.snapeda.com/parts/GCE188R72A103KA01D/Murata%20Electronics%20North%20America/view-part/1764845/?ref=eda; Value: *; Price: None; Purchase-URL: https://pricing.snapeda.com/search/part/GCE188R72A103KA01D/?ref=eda; MP: GCE188R72A103KA01D; Availability: Good; SnapEDA_Link: https://www.snapeda.com/parts/GCE188R72A103KA01D/Murata%20Electronics%20North%20America/view-part/1764845/?ref=snap
F14 = Cau chi tu phuc hoi 2A 24V SMD1812: as F4 on sheet Driver_1
R49 = Tro 0805 5% 560k: as R1 on sheet Driver_1; Chung_Loai: Dán; Kieu_Chan: *
R50 = Tro 0805 5% 330k: as R2 on sheet Driver_1; Chung_Loai: Dán; Kieu_Chan: *
R51 R52 = Tro 0805 1% 0.22R: as R3 on sheet Driver_1; Chung_Loai: Dán; Kieu_Chan: *
R53 R54 R56 = Tro 0805 1% 10k: as R5 on sheet Driver_1; Chung_Loai: Dán; Kieu_Chan: *
R55 = Tro 0805 1% 1M: as R7 on sheet Driver_1; Chung_Loai: Dán; Kieu_Chan: *
U8 = DRV8825PWP: as U1 on sheet Driver_1; Package: None; Availability: Unavailable; Value: *; MP: DRV8825PWP; Price: None

## Sheet Driver_4.SchDoc
size A; SheetNumber: 7; SheetTotal: 7
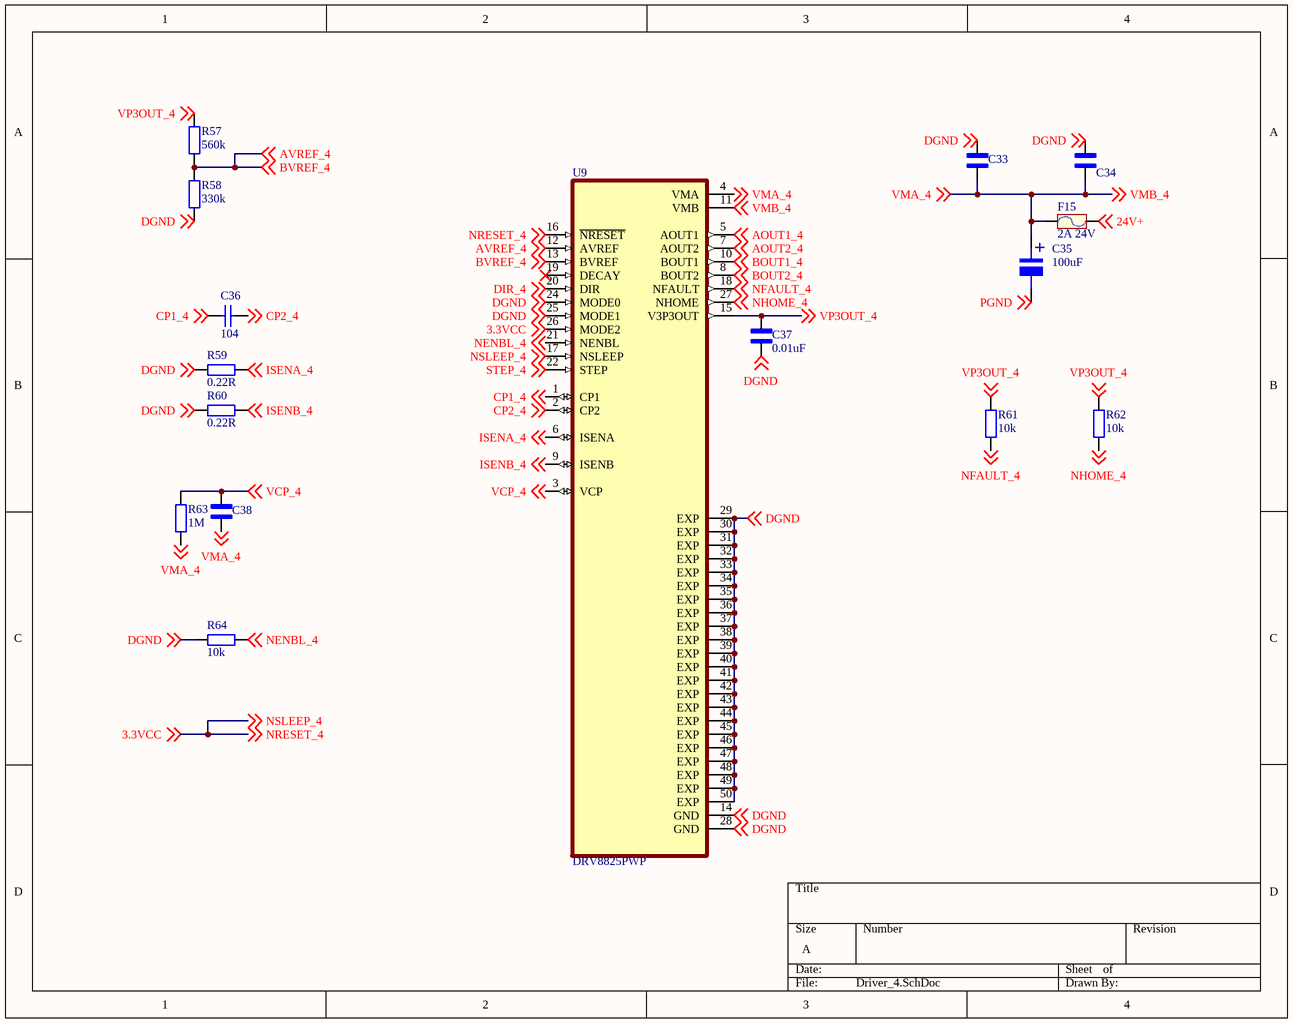
[diagram p6: Driver_4.SchDoc]

### Parts
C33  C0402C104K3RACTU  [CAPC1005X55N]  (value not drawn)
C34  C0402C104K3RACTU  [CAPC1005X55N]  (value not drawn)
C35  100uF  [tu nhom 6.3 (d)]
C36  104  [tu 1206]
C37  0.01uF  [CAPC1608X90N]
C38  C0402C104K3RACTU  [CAPC1005X55N]  (value not drawn)
F15  2A 24V  [Cau chi tu phuc hoi 2A 24V SMD1812]
R57  560k  [Tro SMD 0805]
R58  330k  [Tro SMD 0805]
R59  0.22R  [tro smd 0805]
R60  0.22R  [tro smd 0805]
R61  10k  [tro smd 0805]
R62  10k  [tro smd 0805]
R63  1M  [tro smd 0805]
R64  10k  [tro smd 0805]
U9  DRV8825PWP  [IC_TPS61196PWPRQ1]

### Nets
3.3VCC: U9.16(~{NRESET}) U9.17(NSLEEP) U9.26(MODE2) ; off-sheet 3.3VCC, off-sheet NRESET_4, off-sheet NSLEEP_4  [also labelled NRESET_4, NSLEEP_4]
24V+: F15.2 ; off-sheet 24V+
AOUT1_4: U9.5(AOUT1) ; off-sheet AOUT1_4
AOUT2_4: U9.7(AOUT2) ; off-sheet AOUT2_4
AVREF_4: R57.1 R58.2 U9.12(AVREF) U9.13(BVREF) ; off-sheet AVREF_4, off-sheet BVREF_4  [also labelled BVREF_4]
BOUT1_4: U9.10(BOUT1) ; off-sheet BOUT1_4
BOUT2_4: U9.8(BOUT2) ; off-sheet BOUT2_4
CP1_4: C36.1 U9.1(CP1) ; off-sheet CP1_4
CP2_4: C36.2 U9.2(CP2) ; off-sheet CP2_4
DGND: C33.2 C34.2 C37.1 R58.1 R59.1 R60.1 R64.1 U9.14(GND) U9.24(MODE0) U9.25(MODE1) U9.28(GND) U9.29(EXP) U9.30(EXP) U9.31(EXP) U9.32(EXP) U9.33(EXP) U9.34(EXP) U9.35(EXP) U9.36(EXP) U9.37(EXP) U9.38(EXP) U9.39(EXP) U9.40(EXP) U9.41(EXP) U9.42(EXP) U9.43(EXP) U9.44(EXP) U9.45(EXP) U9.46(EXP) U9.47(EXP) U9.48(EXP) U9.49(EXP) U9.50(EXP) ; off-sheet DGND
DIR_4: U9.20(DIR) ; off-sheet DIR_4
ISENA_4: R59.2 U9.6(ISENA) ; off-sheet ISENA_4
ISENB_4: R60.2 U9.9(ISENB) ; off-sheet ISENB_4
NENBL_4: R64.2 U9.21(NENBL) ; off-sheet NENBL_4
NFAULT_4: R61.1 U9.18(NFAULT) ; off-sheet NFAULT_4
NHOME_4: R62.1 U9.27(NHOME) ; off-sheet NHOME_4
PGND: C35.2 ; off-sheet PGND
STEP_4: U9.22(STEP) ; off-sheet STEP_4
VCP_4: C38.2 R63.2 U9.3(VCP) ; off-sheet VCP_4
VMA_4: C33.1 C34.1 C35.1 C38.1 F15.1 R63.1 U9.4(VMA) U9.11(VMB) ; off-sheet VMA_4, off-sheet VMB_4  [also labelled VMB_4]
VP3OUT_4: C37.2 R57.2 R61.2 R62.2 U9.15(V3P3OUT) ; off-sheet VP3OUT_4

Not connected (* = marked no-connect by the designer): U9 19(DECAY)*

### Notes on the sheet
- (in symbol Tu Nhom 100uF 16V) +

### Library data of the parts
C33 C34 C38 = C0402C104K3RACTU: MF: {'manufacturer': u'KEMET'}; Package: None; Price: None; Value: *; MP: C0402C104K3RACTU; Availability: Unavailable
C35 = Tu Nhom 100uF 16V: as C5 on sheet Driver_1; Chung_Loai: Dán; Kieu_Chan: *
C36 = Tu 1206 104 50V 20%: as C6 on sheet Driver_1; Chung_Loai: Dán; Kieu_Chan: *
C37 = GCE188R72A103KA01D: as C7 on sheet Driver_1; Package: 1608 Murata; Check_prices: https://www.snapeda.com/parts/GCE188R72A103KA01D/Murata%20Electronics%20North%20America/view-part/1764845/?ref=eda; Value: *; Price: None; Purchase-URL: https://pricing.snapeda.com/search/part/GCE188R72A103KA01D/?ref=eda; MP: GCE188R72A103KA01D; Availability: Good; SnapEDA_Link: https://www.snapeda.com/parts/GCE188R72A103KA01D/Murata%20Electronics%20North%20America/view-part/1764845/?ref=snap
F15 = Cau chi tu phuc hoi 2A 24V SMD1812: as F4 on sheet Driver_1
R57 = Tro 0805 5% 560k: as R1 on sheet Driver_1; Chung_Loai: Dán; Kieu_Chan: *
R58 = Tro 0805 5% 330k: as R2 on sheet Driver_1; Chung_Loai: Dán; Kieu_Chan: *
R59 R60 = Tro 0805 1% 0.22R: as R3 on sheet Driver_1; Chung_Loai: Dán; Kieu_Chan: *
R61 R62 R64 = Tro 0805 1% 10k: as R5 on sheet Driver_1; Chung_Loai: Dán; Kieu_Chan: *
R63 = Tro 0805 1% 1M: as R7 on sheet Driver_1; Chung_Loai: Dán; Kieu_Chan: *
U9 = DRV8825PWP: as U1 on sheet Driver_1; Package: None; Availability: Unavailable; Value: *; MP: DRV8825PWP; Price: None

## Nets that join several sheets
GND: Driver_2 (R42.1), Driver_3 (C31.1)
3.3VCC: Driver_1 (U1.16 U1.17 U1.26), ESP32_Board (17 pins), Driver_2 (U7.16 U7.17 U7.26), Driver_3 (U8.16 U8.17 U8.26), Driver_4 (U9.16 U9.17 U9.26)
5V_Logic: Sources (F2.2), ESP32_Board (9 pins)
24V+: Sources (F3.2), Driver_1 (F4.2), Buck_Converter (F5.1 F7.1 F9.1 F11.1), Driver_2 (F13.2), Driver_3 (F14.2), Driver_4 (F15.2)
DGND: Sources (C1.2 PS1.3), Driver_1 (33 pins), Buck_Converter (24 pins), ESP32_Board (7 pins), Driver_2 (31 pins), Driver_3 (32 pins), Driver_4 (33 pins)
DIR_1: Driver_1 (U1.20), ESP32_Board (U6.J2_15)
DIR_2: ESP32_Board (U6.J3_12), Driver_2 (U7.20)
DIR_3: ESP32_Board (U6.J2_11), Driver_3 (U8.20)
DIR_4: ESP32_Board (U6.J3_2), Driver_4 (U9.20)
PGND: Sources (J1.2), Driver_1 (C5.2), Driver_2 (C23.2 C25.1), Driver_3 (C29.2), Driver_4 (C35.2)
STEP_1: Driver_1 (U1.22), ESP32_Board (U6.J2_12)
STEP_2: ESP32_Board (U6.J3_11), Driver_2 (U7.22)
STEP_3: ESP32_Board (U6.J2_7), Driver_3 (U8.22)
STEP_4: ESP32_Board (U6.J2_8), Driver_4 (U9.22)